# EasyEDA schematic SCH_Gpio-Expander_2026-10-10 (1).json
TITLE: Sheet_1; REV: 1.0; Date: 2024-11-11; Sheet: 1/1; Drawn By: Sven92; Company: Your Company
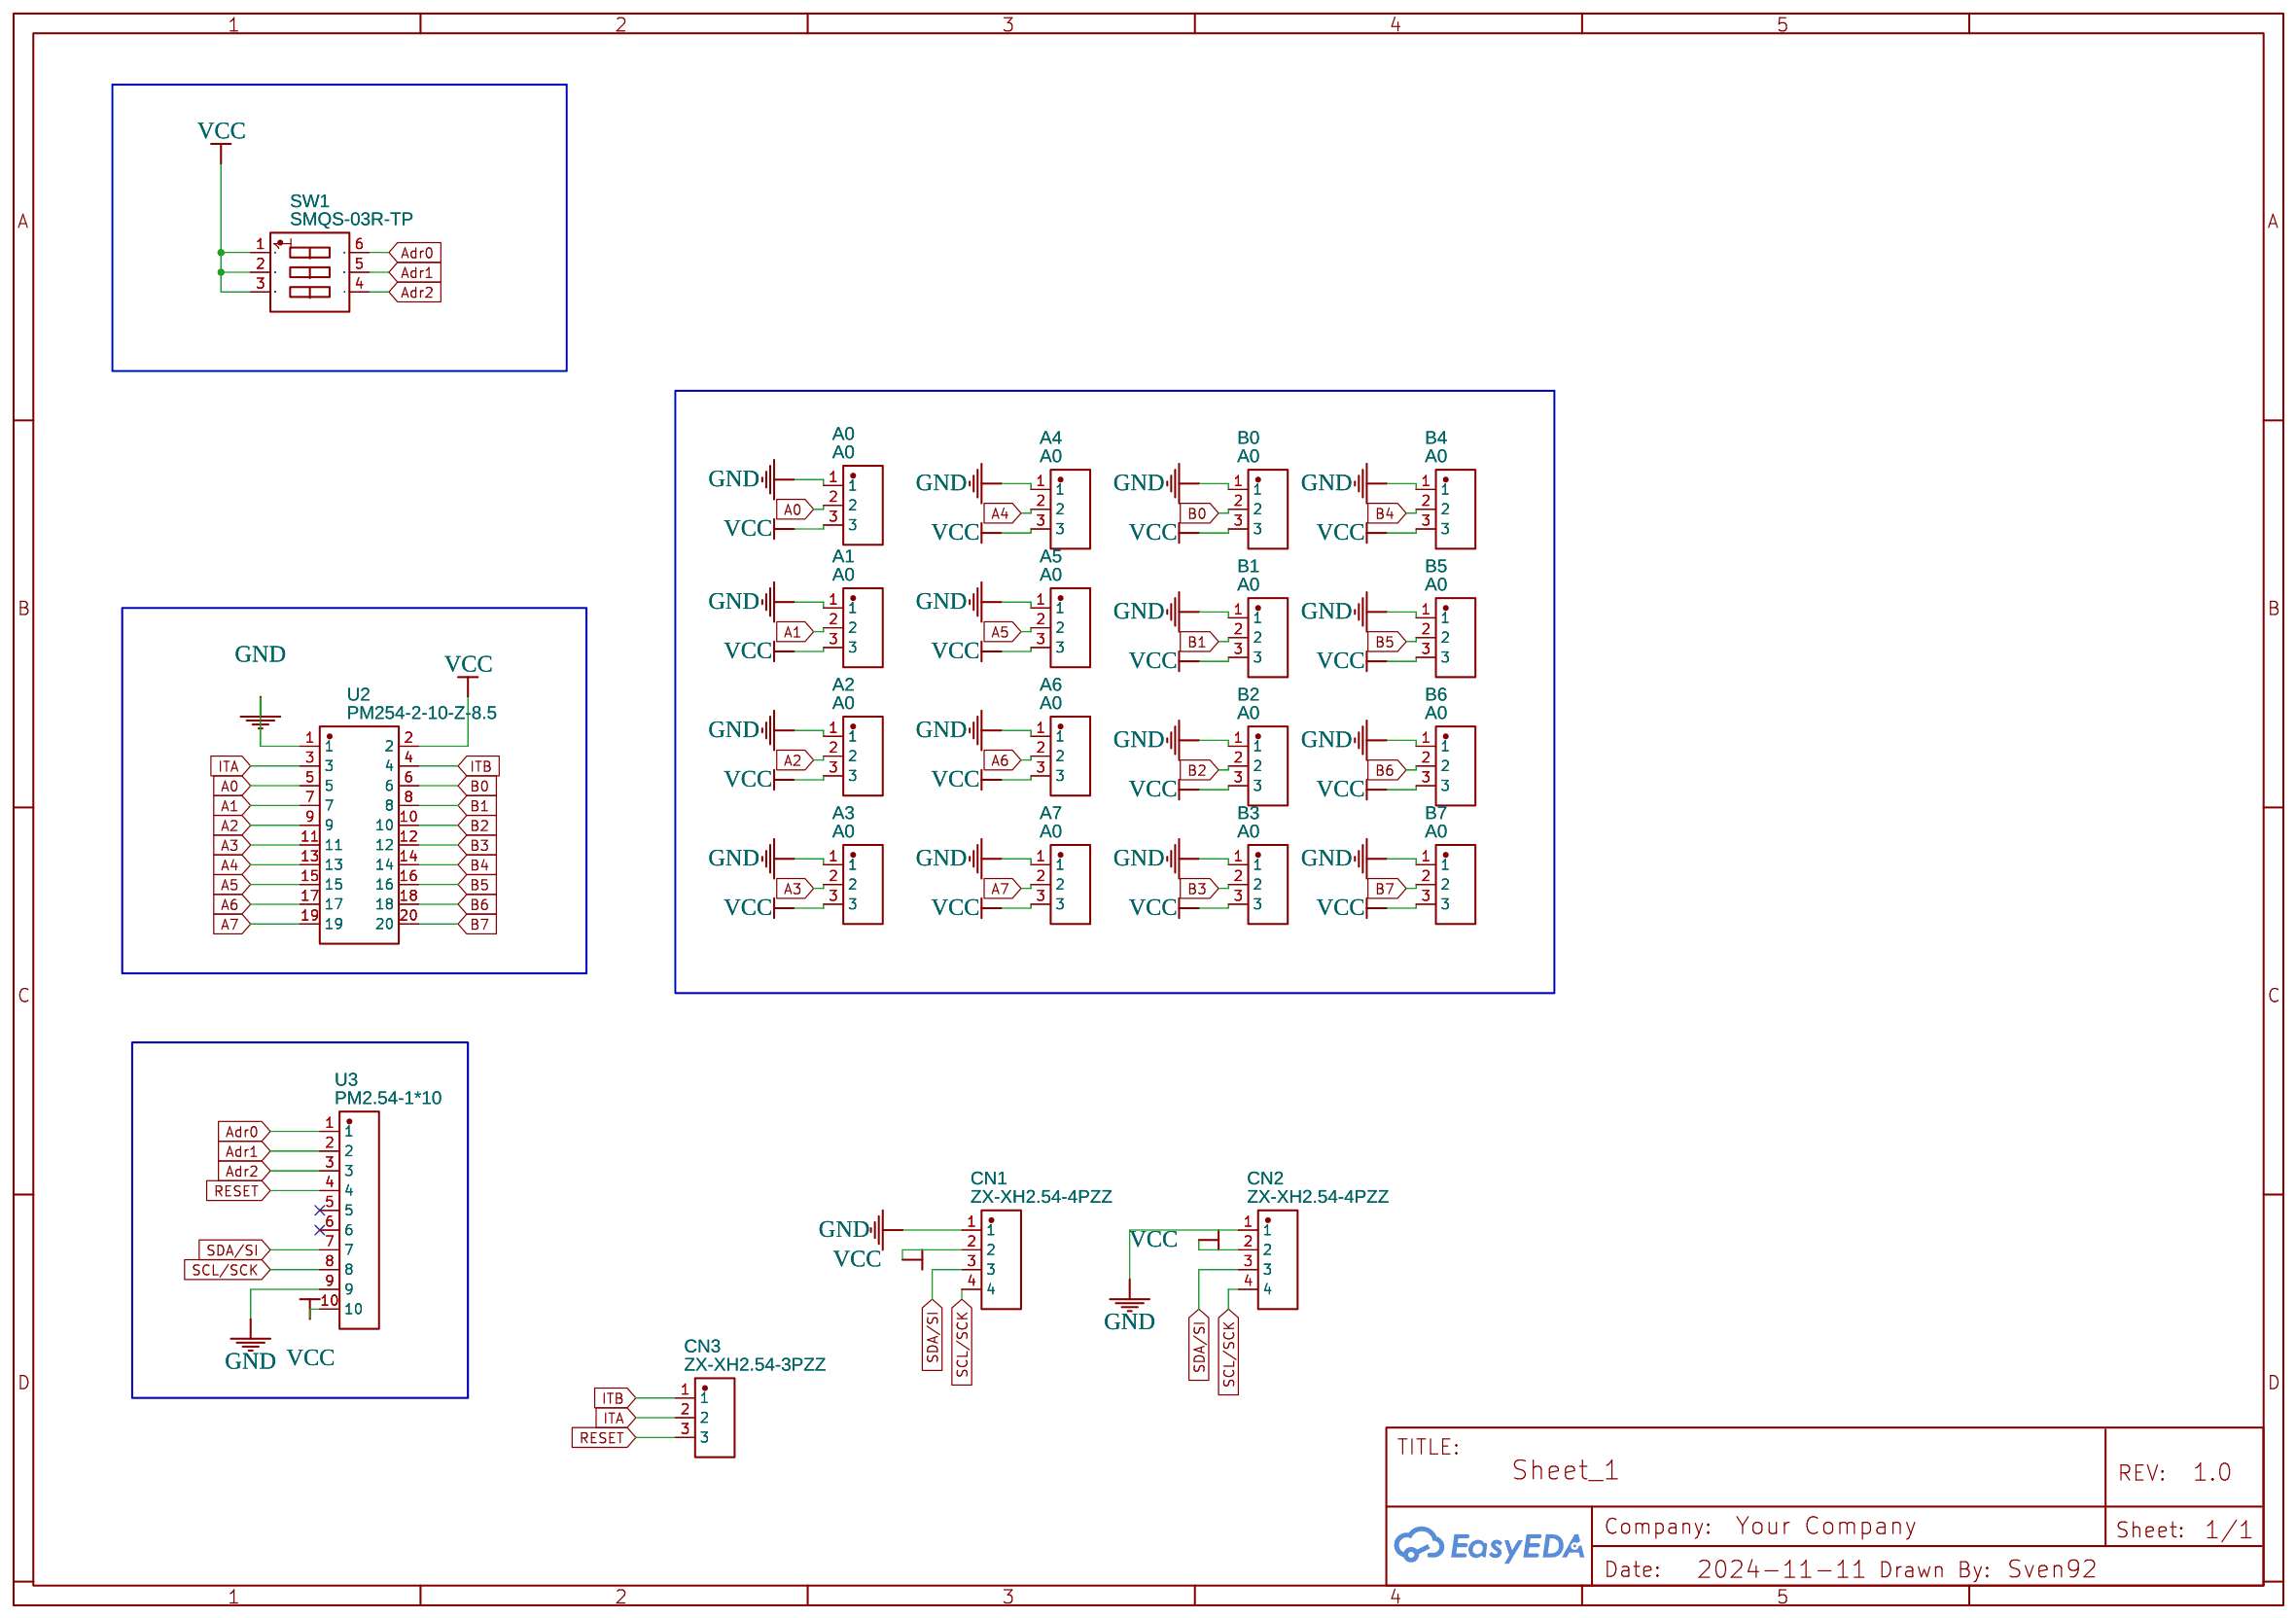
[diagram p0: schematic sheet]

## Parts
A0  A0  [CONN-TH_MX2EDGVC-2.54-03P-GN01-CU-A]
A1  A0  [CONN-TH_MX2EDGVC-2.54-03P-GN01-CU-A]
A2  A0  [CONN-TH_MX2EDGVC-2.54-03P-GN01-CU-A]
A3  A0  [CONN-TH_MX2EDGVC-2.54-03P-GN01-CU-A]
A4  A0  [CONN-TH_MX2EDGVC-2.54-03P-GN01-CU-A]
A5  A0  [CONN-TH_MX2EDGVC-2.54-03P-GN01-CU-A]
A6  A0  [CONN-TH_MX2EDGVC-2.54-03P-GN01-CU-A]
A7  A0  [CONN-TH_MX2EDGVC-2.54-03P-GN01-CU-A]
B0  A0  [CONN-TH_MX2EDGVC-2.54-03P-GN01-CU-A]
B1  A0  [CONN-TH_MX2EDGVC-2.54-03P-GN01-CU-A]
B2  A0  [CONN-TH_MX2EDGVC-2.54-03P-GN01-CU-A]
B3  A0  [CONN-TH_MX2EDGVC-2.54-03P-GN01-CU-A]
B4  A0  [CONN-TH_MX2EDGVC-2.54-03P-GN01-CU-A]
B5  A0  [CONN-TH_MX2EDGVC-2.54-03P-GN01-CU-A]
B6  A0  [CONN-TH_MX2EDGVC-2.54-03P-GN01-CU-A]
B7  A0  [CONN-TH_MX2EDGVC-2.54-03P-GN01-CU-A]
CN1  ZX-XH2.54-4PZZ  [CONN-TH_4P-P2.50_4PIN]
CN2  ZX-XH2.54-4PZZ  [CONN-TH_4P-P2.50_4PIN]
CN3  ZX-XH2.54-3PZZ  [CONN-TH_3P-P2.54_2501S-3P]
SW1  SMQS-03R-TP  [SW-TH_SMQS-03B-TP]
U2  PM254-2-10-Z-8.5  [HDR-TH_20P-P2.54-V-F-R2-C10-S2.54]
U3  PM2.54-1*10  [HDR-TH_10P-P2.54-V-F]

## Library data of the parts
A0-A7 B0-B7 = MX2EDGVC-2.54-03P-GN01-CU-A: Supplier: LCSC; Supplier Part: C5290419; Manufacturer: MAX(迈旭); Manufacturer Part: MX2EDGVC-2.54-03P-GN01-Cu-A; JLCPCB Part Class: Extended Part; Contributor: lcsc
CN1 CN2 = ZX-XH2.54-4PZZ: Contributor: lcsc; Supplier: LCSC; Supplier Part: C7429634; Manufacturer: Megastar(兆星); JLCPCB Part Class: Extended Part
CN3 = ZX-XH2.54-3PZZ: Contributor: lcsc; Supplier: LCSC; Supplier Part: C7429633; Manufacturer: Megastar(兆星); JLCPCB Part Class: Extended Part
SW1 = SMQS-03R-TP: Supplier: LCSC; Supplier Part: C5299504; Manufacturer: SM Switch; Contributor: lcsc
U2 = PM254-2-10-Z-8.5: Contributor: LCSC; Supplier: LCSC; Supplier Part: C2897411; Manufacturer: HCTL(华灿天禄); JLCPCB Part Class: Extended Part
U3 = PM2.54-1*10: Contributor: lcsc; Supplier: LCSC; Supplier Part: C5116489; Manufacturer: ZHOURI(洲日); JLCPCB Part Class: Extended Part

## Nets
GND: A0.1 A1.1 A2.1 A3.1 A4.1 A5.1 A6.1 A7.1 B0.1 B1.1 B2.1 B3.1 B4.1 B5.1 B6.1 B7.1 CN1.1 CN2.1 U2.1 U3.9
VCC: A0.3 A1.3 A2.3 A3.3 A4.3 A5.3 A6.3 A7.3 B0.3 B1.3 B2.3 B3.3 B4.3 B5.3 B6.3 B7.3 CN1.2 CN2.2 SW1.1 SW1.2 SW1.3 U2.2 U3.10
A0: A0.2 U2.5
A1: A1.2 U2.7
A2: A2.2 U2.9
A3: A3.2 U2.11
A4: A4.2 U2.13
A5: A5.2 U2.15
A6: A6.2 U2.17
A7: A7.2 U2.19
Adr0: SW1.6 U3.1
Adr1: SW1.5 U3.2
Adr2: SW1.4 U3.3
B0: B0.2 U2.6
B1: B1.2 U2.8
B2: B2.2 U2.10
B3: B3.2 U2.12
B4: B4.2 U2.14
B5: B5.2 U2.16
B6: B6.2 U2.18
B7: B7.2 U2.20
ITA: CN3.2 U2.3
ITB: CN3.1 U2.4
RESET: CN3.3 U3.4
SCL/SCK: CN1.4 CN2.4 U3.8
SDA/SI: CN1.3 CN2.3 U3.7

Not connected (* = marked no-connect by the designer): U3 5* 6*
